# Altium schematic sheet Ext_GPIO_Bank1.SchDoc
size A3
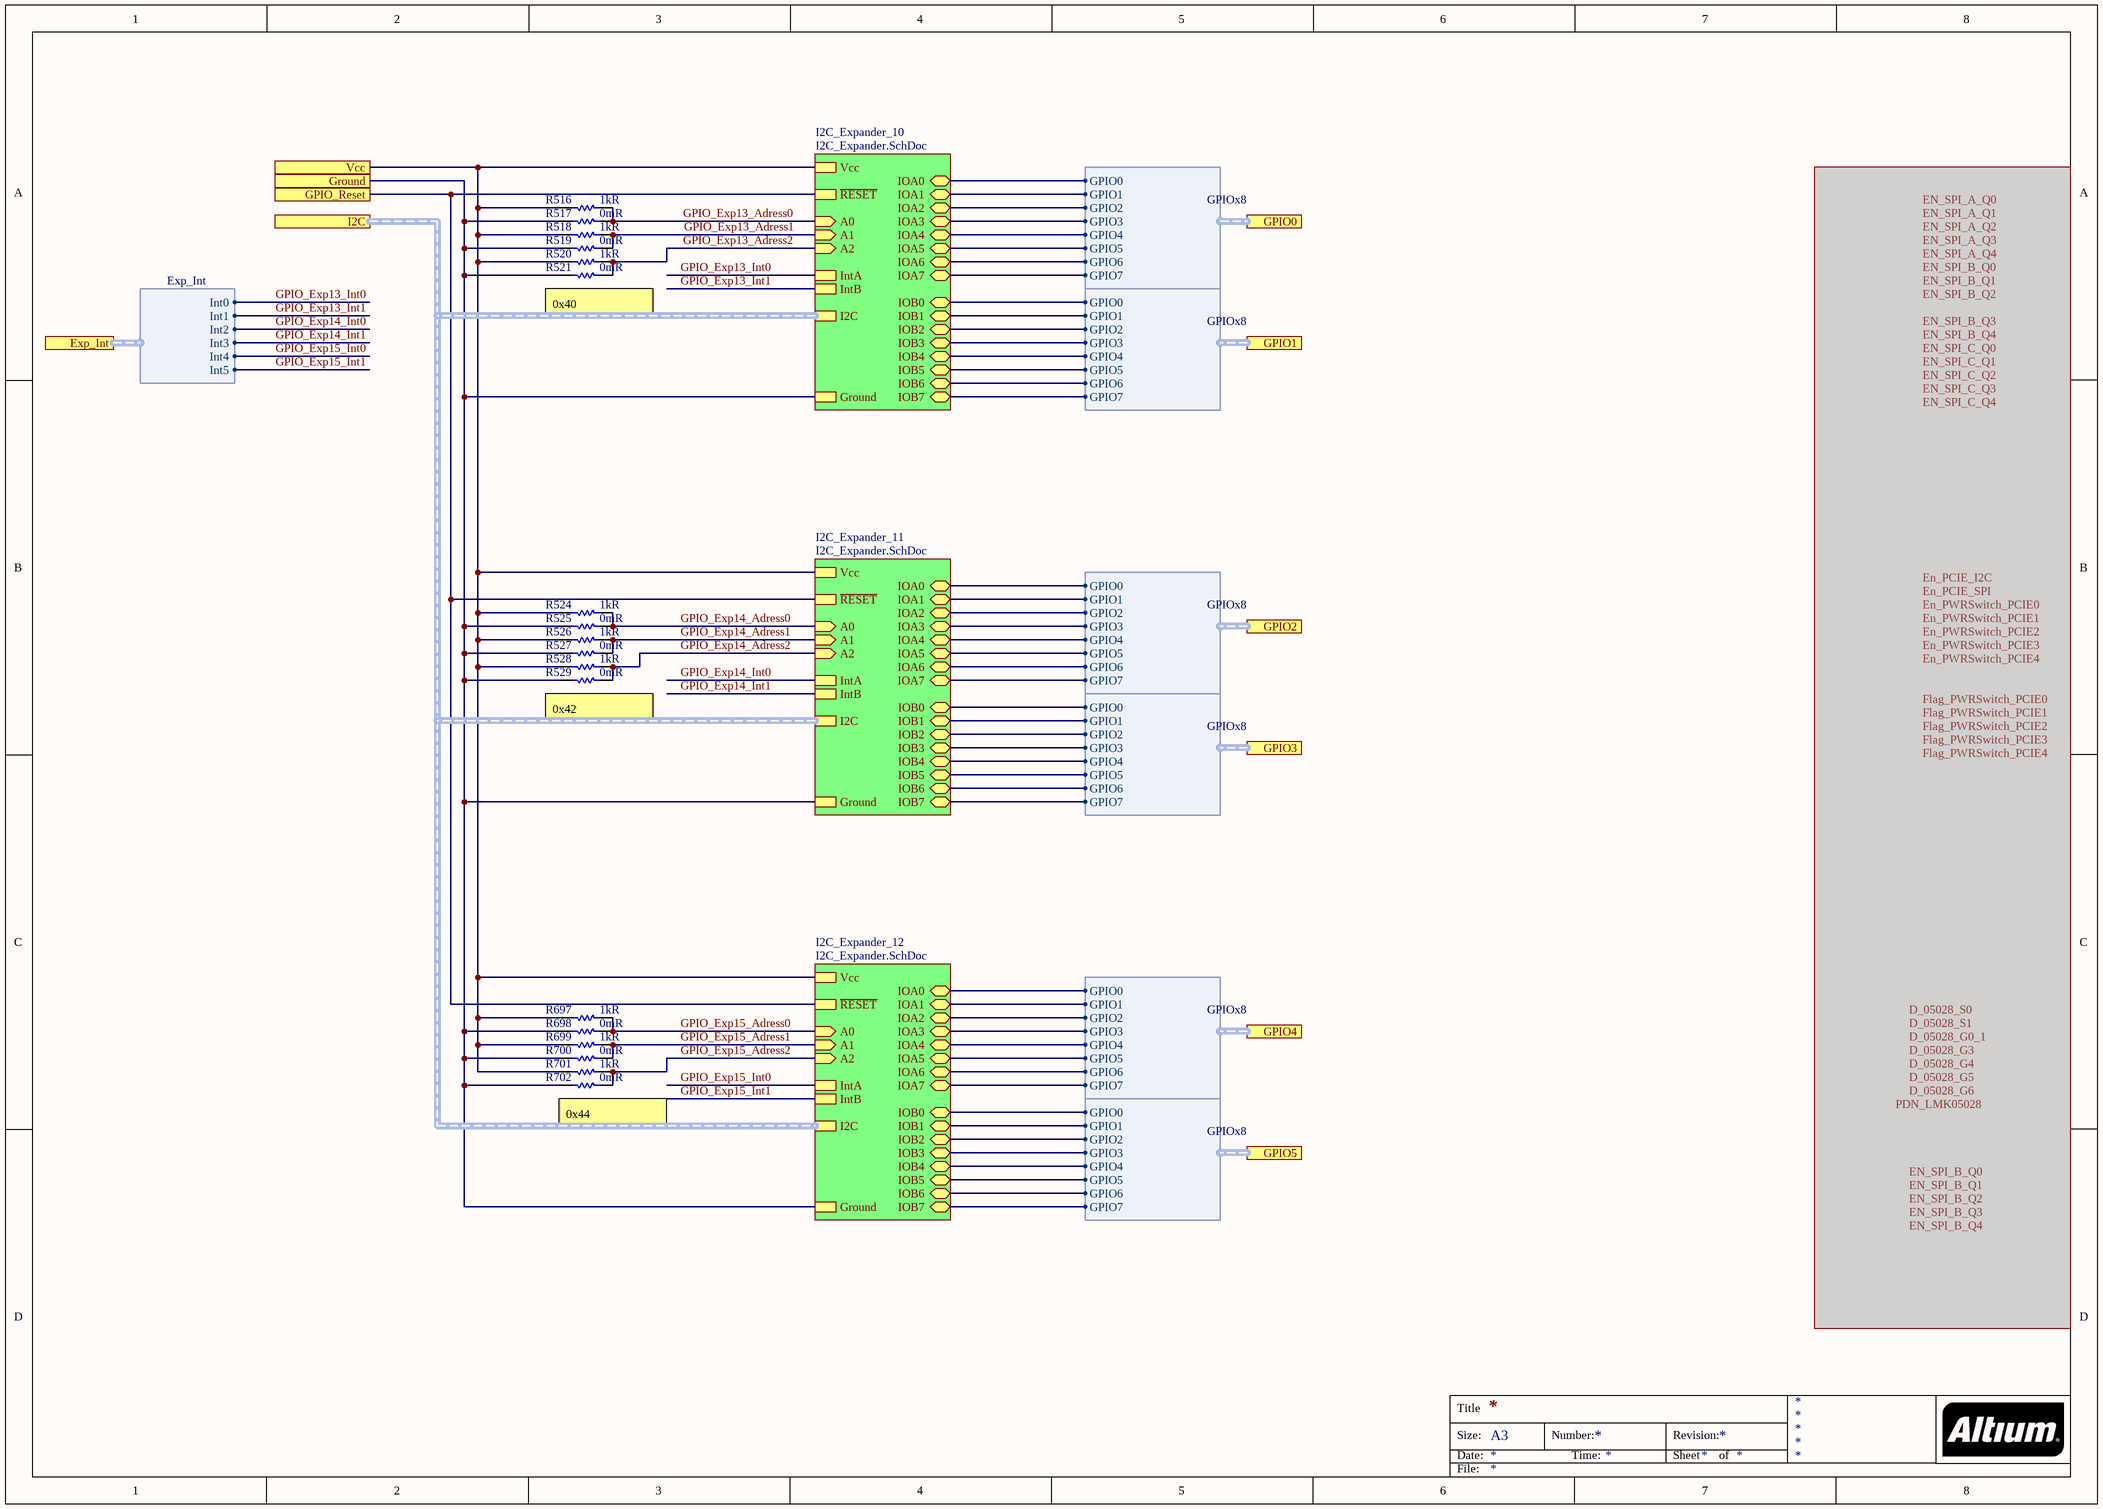
[diagram p0: Ext_GPIO_Bank1.SchDoc]

## Parts
R516  1kR  [RES 0402/1005 RF KK]
R517  0mR  [RES 0402/1005 RF KK]
R518  1kR  [RES 0402/1005 RF KK]
R519  0mR  [RES 0402/1005 RF KK]
R520  1kR  [RES 0402/1005 RF KK]
R521  0mR  [RES 0402/1005 RF KK]
R524  1kR  [RES 0402/1005 RF KK]
R525  0mR  [RES 0402/1005 RF KK]
R526  1kR  [RES 0402/1005 RF KK]
R527  0mR  [RES 0402/1005 RF KK]
R528  1kR  [RES 0402/1005 RF KK]
R529  0mR  [RES 0402/1005 RF KK]
R697  1kR  [RES 0402/1005 RF KK]
R698  0mR  [RES 0402/1005 RF KK]
R699  1kR  [RES 0402/1005 RF KK]
R700  0mR  [RES 0402/1005 RF KK]
R701  1kR  [RES 0402/1005 RF KK]
R702  0mR  [RES 0402/1005 RF KK]

## Sub-sheets
I2C_Expander_10 = I2C_Expander.SchDoc: IOA7 (bidir), IOA3 (bidir), IOA6 (bidir), IOA1 (bidir), IOA0 (bidir), IOA5 (bidir), IOB1 (bidir), IOB2 (bidir), IOB5 (bidir), IOB6 (bidir), IOB7 (bidir), IntA, IntB, Ground, IOB4 (bidir), IOB3 (bidir), IOA2 (bidir), IOA4 (bidir), IOB0 (bidir), Vcc, ~{RESET}, I2C (harness I2C), A2 (in), A1 (in), A0 (in)
I2C_Expander_11 = I2C_Expander.SchDoc: IOA7 (bidir), IOA3 (bidir), IOA6 (bidir), IOA1 (bidir), IOA0 (bidir), IOA5 (bidir), IOB1 (bidir), IOB2 (bidir), IOB5 (bidir), IOB6 (bidir), IOB7 (bidir), IntA, IntB, Ground, IOB4 (bidir), IOB3 (bidir), IOA2 (bidir), IOA4 (bidir), IOB0 (bidir), Vcc, ~{RESET}, I2C (harness I2C), A2 (in), A1 (in), A0 (in)
I2C_Expander_12 = I2C_Expander.SchDoc: IOA7 (bidir), IOA3 (bidir), IOA6 (bidir), IOA1 (bidir), IOA0 (bidir), IOA5 (bidir), IOB1 (bidir), IOB2 (bidir), IOB5 (bidir), IOB6 (bidir), IOB7 (bidir), IntA, IntB, Ground, IOB4 (bidir), IOB3 (bidir), IOA2 (bidir), IOA4 (bidir), IOB0 (bidir), Vcc, ~{RESET}, I2C (harness I2C), A2 (in), A1 (in), A0 (in)

## Ports
Exp_Int (harness Exp_Int), GPIO0 (harness GPIOx8), GPIO1 (harness GPIOx8), GPIO2 (harness GPIOx8), GPIO3 (harness GPIOx8), GPIO4 (harness GPIOx8), GPIO5 (harness GPIOx8), GPIO_Reset, Ground, I2C (harness I2C), Vcc

## Harnesses
GPIOx8: GPIO0, GPIO1, GPIO2, GPIO3, GPIO4, GPIO5, GPIO6, GPIO7
Exp_Int: Int0, Int1, Int2, Int3, Int4, Int5

## Nets
GPIO_Exp13_Adress0: R516.2 R517.1 ; sheet I2C_Expander_10/A0
GPIO_Exp13_Adress1: R518.2 R519.1 ; sheet I2C_Expander_10/A1
GPIO_Exp13_Adress2: R520.2 R521.1 ; sheet I2C_Expander_10/A2
GPIO_Exp13_Int0: sheet I2C_Expander_10/IntA, port Exp_Int.Int0
GPIO_Exp13_Int1: sheet I2C_Expander_10/IntB, port Exp_Int.Int1
GPIO_Exp14_Adress0: R524.2 R525.1 ; sheet I2C_Expander_11/A0
GPIO_Exp14_Adress1: R526.2 R527.1 ; sheet I2C_Expander_11/A1
GPIO_Exp14_Adress2: R528.2 R529.1 ; sheet I2C_Expander_11/A2
GPIO_Exp14_Int0: sheet I2C_Expander_11/IntA, port Exp_Int.Int2
GPIO_Exp14_Int1: sheet I2C_Expander_11/IntB, port Exp_Int.Int3
GPIO_Exp15_Adress0: R697.2 R698.1 ; sheet I2C_Expander_12/A0
GPIO_Exp15_Adress1: R699.2 R700.1 ; sheet I2C_Expander_12/A1
GPIO_Exp15_Adress2: R701.2 R702.1 ; sheet I2C_Expander_12/A2
GPIO_Exp15_Int0: sheet I2C_Expander_12/IntA, port Exp_Int.Int4
GPIO_Exp15_Int1: sheet I2C_Expander_12/IntB, port Exp_Int.Int5
GPIO_Reset: port GPIO_Reset, sheet I2C_Expander_10/~{RESET}, sheet I2C_Expander_11/~{RESET}, sheet I2C_Expander_12/~{RESET}
Ground: R517.2 R519.2 R521.2 R525.2 R527.2 R529.2 R698.2 R700.2 R702.2 ; port Ground, sheet I2C_Expander_10/Ground, sheet I2C_Expander_11/Ground, sheet I2C_Expander_12/Ground
Vcc: R516.1 R518.1 R520.1 R524.1 R526.1 R528.1 R697.1 R699.1 R701.1 ; port Vcc, sheet I2C_Expander_10/Vcc, sheet I2C_Expander_11/Vcc, sheet I2C_Expander_12/Vcc
(unnamed): sheet I2C_Expander_10/IOA7, port GPIO0.GPIO7
(unnamed): sheet I2C_Expander_10/IOA3, port GPIO0.GPIO3
(unnamed): sheet I2C_Expander_10/IOA6, port GPIO0.GPIO6
(unnamed): sheet I2C_Expander_10/IOA1, port GPIO0.GPIO1
(unnamed): sheet I2C_Expander_10/IOA0, port GPIO0.GPIO0
(unnamed): sheet I2C_Expander_10/IOA5, port GPIO0.GPIO5
(unnamed): sheet I2C_Expander_10/IOB1, port GPIO1.GPIO1
(unnamed): sheet I2C_Expander_10/IOB2, port GPIO1.GPIO2
(unnamed): sheet I2C_Expander_10/IOB5, port GPIO1.GPIO5
(unnamed): sheet I2C_Expander_10/IOB6, port GPIO1.GPIO6
(unnamed): sheet I2C_Expander_10/IOB7, port GPIO1.GPIO7
(unnamed): sheet I2C_Expander_10/IOB4, port GPIO1.GPIO4
(unnamed): sheet I2C_Expander_10/IOB3, port GPIO1.GPIO3
(unnamed): sheet I2C_Expander_10/IOA2, port GPIO0.GPIO2
(unnamed): sheet I2C_Expander_10/IOA4, port GPIO0.GPIO4
(unnamed): sheet I2C_Expander_10/IOB0, port GPIO1.GPIO0
(unnamed): sheet I2C_Expander_11/IOA7, port GPIO2.GPIO7
(unnamed): sheet I2C_Expander_11/IOA3, port GPIO2.GPIO3
(unnamed): sheet I2C_Expander_11/IOA6, port GPIO2.GPIO6
(unnamed): sheet I2C_Expander_11/IOA1, port GPIO2.GPIO1
(unnamed): sheet I2C_Expander_11/IOA0, port GPIO2.GPIO0
(unnamed): sheet I2C_Expander_11/IOA5, port GPIO2.GPIO5
(unnamed): sheet I2C_Expander_11/IOB1, port GPIO3.GPIO1
(unnamed): sheet I2C_Expander_11/IOB2, port GPIO3.GPIO2
(unnamed): sheet I2C_Expander_11/IOB5, port GPIO3.GPIO5
(unnamed): sheet I2C_Expander_11/IOB6, port GPIO3.GPIO6
(unnamed): sheet I2C_Expander_11/IOB7, port GPIO3.GPIO7
(unnamed): sheet I2C_Expander_11/IOB4, port GPIO3.GPIO4
(unnamed): sheet I2C_Expander_11/IOB3, port GPIO3.GPIO3
(unnamed): sheet I2C_Expander_11/IOA2, port GPIO2.GPIO2
(unnamed): sheet I2C_Expander_11/IOA4, port GPIO2.GPIO4
(unnamed): sheet I2C_Expander_11/IOB0, port GPIO3.GPIO0
(unnamed): sheet I2C_Expander_12/IOA7, port GPIO4.GPIO7
(unnamed): sheet I2C_Expander_12/IOA3, port GPIO4.GPIO3
(unnamed): sheet I2C_Expander_12/IOA6, port GPIO4.GPIO6
(unnamed): sheet I2C_Expander_12/IOA1, port GPIO4.GPIO1
(unnamed): sheet I2C_Expander_12/IOA0, port GPIO4.GPIO0
(unnamed): sheet I2C_Expander_12/IOA5, port GPIO4.GPIO5
(unnamed): sheet I2C_Expander_12/IOB1, port GPIO5.GPIO1
(unnamed): sheet I2C_Expander_12/IOB2, port GPIO5.GPIO2
(unnamed): sheet I2C_Expander_12/IOB5, port GPIO5.GPIO5
(unnamed): sheet I2C_Expander_12/IOB6, port GPIO5.GPIO6
(unnamed): sheet I2C_Expander_12/IOB7, port GPIO5.GPIO7
(unnamed): sheet I2C_Expander_12/IOB4, port GPIO5.GPIO4
(unnamed): sheet I2C_Expander_12/IOB3, port GPIO5.GPIO3
(unnamed): sheet I2C_Expander_12/IOA2, port GPIO4.GPIO2
(unnamed): sheet I2C_Expander_12/IOA4, port GPIO4.GPIO4
(unnamed): sheet I2C_Expander_12/IOB0, port GPIO5.GPIO0

## Buses and harness runs
harness port I2C = sheet I2C_Expander_10/I2C = sheet I2C_Expander_11/I2C = sheet I2C_Expander_12/I2C

## Notes on the sheet
- (near R521) 0x40
- (near R529) 0x42
- (near R702) 0x44
- Title
- Size:
- Date:
- A3
- Number:
- Time:
- Revision:
- Sheet
- of
- File:

## Library data of the parts
R516 R518 R520 R524 R526 R528 R697 R699 R701 = Resistor: PANASONIC - ERJ-2RKF1001X - SMD Chip Resistor, 0402 [1005 Metric], 1 kohm, ERJ2R Series, 50 V, Thick Film, 100 mW; Temperature Coefficient: 100ppm/°C; Tolerance: 1%; Voltage Rating (DC): 50V; Power Rating: 100mW; Supplier 1: Digi-Key; Supplier Part Number 1: P1.00KLDKR-ND; Manufacturer: Panasonic; Manufacturer Part Number: ERJ-2RKF1001X; RoHS: Yes; Category: Chip SMD Resistors; Stock 1: 1864188; Pricing 1: 1=0,10000, 10=0,04300, 100=0,01740, 1000=0,00782, 2500=0,00678, 5000=0,00561 (USD); Mount: Surface Mount; Case/Package: 0402; Number of Pins: 2; Contact Plating: Tin; Case Code (Imperial): 0402; Case Code (Metric): 1005; Min Operating Temperature: -55°C; Max Operating Temperature: 155°C; Composition: Thick Film; Resistance: 1kR; Termination: SMD/SMT; Number of Terminations: 2; Military Standard: Not; Features: Automotive AEC-Q200; Packaging: Tape and Reel; Voltage Rating: 50V; Package Quantity: 1; Max Power Dissipation: 100mW; Working Voltage: 50V; Length: 1mm; Height: 0.35mm; Depth: 0.5mm; Width: 0.5mm; Radiation Hardening: No; Lead Free: Lead Free; REACH SVHC: No SVHC; ComponentLink1URL: https://datasheet.ciiva.com/11821/0900766b80f80784-11821203.pdf?src-supplier=RSComponents; ComponentLink1Description: https://datasheet.ciiva.com/11821/0900766b80f80784-11821203.pdf?src-supplier=RSComponents; ComponentLink2URL: https://datasheet.ciiva.com/7942/aoa0000ce2-7942426.pdf?src-supplier=Element14; ComponentLink2Description: https://datasheet.ciiva.com/7942/aoa0000ce2-7942426.pdf?src-supplier=Element14; ComponentLink3URL: https://datasheet.ciiva.com/16523/aoa0000ce2-16523834.pdf?src-supplier=Avnet+Asia; ComponentLink3Description: https://datasheet.ciiva.com/16523/aoa0000ce2-16523834.pdf?src-supplier=Avnet+Asia; ComponentLink4URL: https://datasheet.ciiva.com/17215/aoa0000ce2-17215308.pdf?src-supplier=Avnet+Europe; ComponentLink4Description: https://datasheet.ciiva.com/17215/aoa0000ce2-17215308.pdf?src-supplier=Avnet+Europe; ComponentLink5URL: https://datasheet.ciiva.com/22673/1678782-22673916.pdf?src-supplier=Element14; ComponentLink5Description: https://datasheet.ciiva.com/22673/1678782-22673916.pdf?src-supplier=Element14; ComponentLink6URL: https://datasheet.ciiva.com/28532/1678782-28532109.pdf?src-supplier=Element14; ComponentLink6Description: https://datasheet.ciiva.com/28532/1678782-28532109.pdf?src-supplier=Element14; ComponentLink7URL: https://datasheet.ciiva.com/16767/70260748-16767559.pdf?src-supplier=Allied+Electronics; ComponentLink7Description: https://datasheet.ciiva.com/16767/70260748-16767559.pdf?src-supplier=Allied+Electronics; ComponentLink8URL: https://datasheet.ciiva.com/9198/aoa0000ce2-9198920.pdf?src-supplier=Avnet; ComponentLink8Description: https://datasheet.ciiva.com/9198/aoa0000ce2-9198920.pdf?src-supplier=Avnet; ComponentLink9URL: https://datasheet.ciiva.com/16771/70260748-16771979.pdf?src-supplier=Allied+Electronics; ComponentLink9Description: https://datasheet.ciiva.com/16771/70260748-16771979.pdf?src-supplier=Allied+Electronics
R517 R519 R521 R525 R527 R529 R698 R700 R702 = Resistor: Manufacturer 1: Yageo; Manufacturer Part Number 1: RC0402JR-070RL; Power Rating: 62.5mW; Tolerance: 5%; Voltage Rating: 50V; Max Power Dissipation: 63mW; Temperature Coefficient: 200ppm/°C; Supplier 1: Digi-Key; Supplier Part Number 1: 311-0.0JRCT-ND; Stock 1: 69822252; Pricing 1: 1=0.10000, 10=0.01200, 25=0.00920, 50=0.00680, 100=0.00510, 250=0.00388, 500=0.00308, 1000=0.00227, 5000=0.00163 (USD); RoHS: Yes; Case/Package: 0402; Contact Plating: Tin,Matte; Case Code (Metric): 1005; Case Code (Imperial): 0402; Min Operating Temperature: -55°C; Max Operating Temperature: 155°C; Resistance: 0mR; Packaging: Tape and Reel; Composition: Thick Film; Package Quantity: 1; Number of Terminations: 2; Termination: SMD/SMT; Military Standard: Not; Features: Moisture Resistant; Length: 1mm; Height: 0.016inch; Width: 0.02inch; Depth: 0.5mm; Radiation Hardening: No; REACH SVHC: Unknown; Lead Free: Lead Free; ComponentLink1URL: https://datasheet.ciiva.com/2452/pyu-rc0402-51-rohs-l-6-2452608.pdf?src-supplier=Digi-Key; ComponentLink1Description: https://datasheet.ciiva.com/2452/pyu-rc0402-51-rohs-l-6-2452608.pdf?src-supplier=Digi-Key; ComponentLink2URL: https://datasheet.ciiva.com/11808/0900766b80c66297-11808195.pdf?src-supplier=RSComponents; ComponentLink2Description: https://datasheet.ciiva.com/11808/0900766b80c66297-11808195.pdf?src-supplier=RSComponents; ComponentLink3URL: https://datasheet.ciiva.com/2452/pyu-r-int-thick-7-2452609.pdf?src-supplier=Digi-Key; ComponentLink3Description: https://datasheet.ciiva.com/2452/pyu-r-int-thick-7-2452609.pdf?src-supplier=Digi-Key; ComponentLink4URL: https://datasheet.ciiva.com/22747/1018594-22747515.pdf?src-supplier=Element14; ComponentLink4Description: https://datasheet.ciiva.com/22747/1018594-22747515.pdf?src-supplier=Element14; ComponentLink5URL: https://datasheet.ciiva.com/7983/1018594-7983535.pdf?src-supplier=Element14; ComponentLink5Description: https://datasheet.ciiva.com/7983/1018594-7983535.pdf?src-supplier=Element14; ComponentLink6URL: https://datasheet.ciiva.com/2452/pyu-r-int-thick-7-2452610.pdf?src-supplier=Digi-Key; ComponentLink6Description: https://datasheet.ciiva.com/2452/pyu-r-int-thick-7-2452610.pdf?src-supplier=Digi-Key; ComponentLink7URL: https://datasheet.ciiva.com/8896/pyu-rc0402-51-rohs-l-6-8896201.pdf?src-supplier=Avnet; ComponentLink7Description: https://datasheet.ciiva.com/8896/pyu-rc0402-51-rohs-l-6-8896201.pdf?src-supplier=Avnet; ComponentLink8URL: https://datasheet.ciiva.com/28386/pyu-rc0402-51-rohs-l-6-28386633.pdf?src-supplier=Avnet+Europe; ComponentLink8Description: https://datasheet.ciiva.com/28386/pyu-rc0402-51-rohs-l-6-28386633.pdf?src-supplier=Avnet+Europe; ComponentLink9URL: https://datasheet.ciiva.com/15189/getdatasheetpartid-326379-15189533.pdf?src-supplier=Verical; ComponentLink9Description: https://datasheet.ciiva.com/15189/getdatasheetpartid-326379-15189533.pdf?src-supplier=Verical